# Altium schematic sheet [03] - BLE MODULE AND CONNECTIONS.SchDoc
size A; SheetNumber: 1; SheetTotal: 4
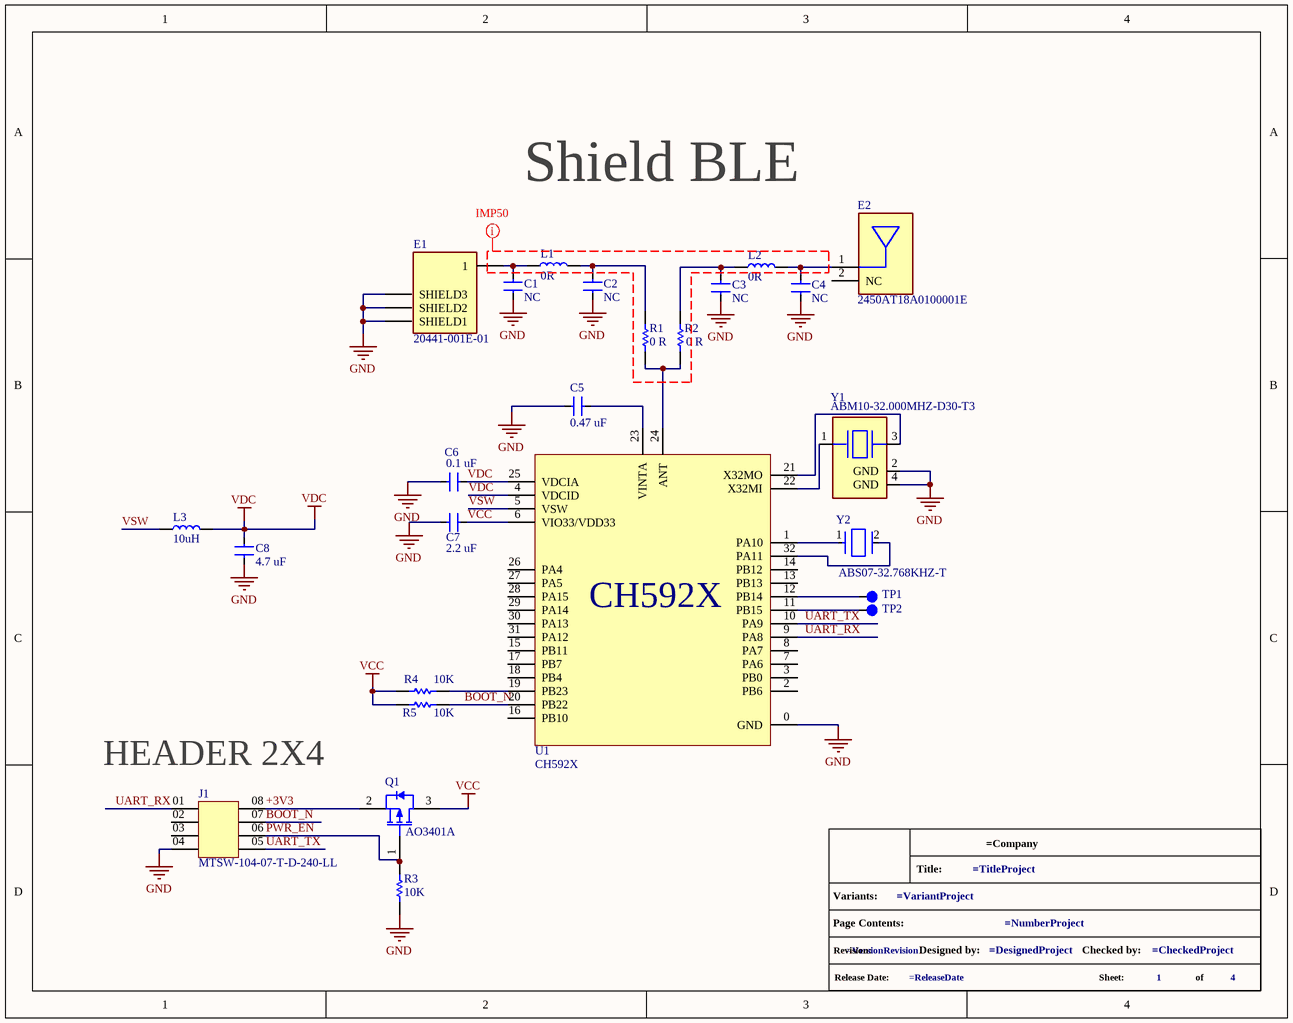
[diagram p0: [03] - BLE MODULE AND CONNECTIONS.SchDoc]

## Parts
C1  NC  [C0402]
C2  NC  [C0402]
C3  NC  [C0402]
C4  NC  [C0402]
C5  0.47 uF  [C0402]
C6  0.1 uF  [C0402]
C7  2.2 uF  [C0402]
C8  4.7 uF  [C0402]
E1  20441-001E-01  [IPEX_20441-001E-01]
E2  2450AT18A0100001E  [XCVR_2450AT18A0100001E]
GPH?  info_project  (value not drawn)  (graphical)
J1  MTSW-104-07-T-D-240-LL  [SAMTEC_MTSW-104-07-T-D-240-LL]
L1  0R  [L0402]
L2  0R  [L0402]
L3  10uH  [L0402]
Q1  AO3401A  [AO-SOT-23-3L_V]
R1  0 R  [R0402]
R2  0 R  [R0402]
R3  10K  [R0402]
R4  10K  [R0402]
R5  10K  [R0402]
TP1  TestPoint  [Test Point]  (value not drawn)  (no BOM)
TP2  TestPoint  [Test Point]  (value not drawn)  (no BOM)
U1  CH592X  [QFN40P400X400X80_HS-33N]
Y1  ABM10-32.000MHZ-D30-T3  [XTAL_ABM10-32.000MHZ-D30-T3]
Y2  ABS07-32.768KHZ-T  [FP-ABS07-MFG]

## Nets
GND: C1.1 C2.1 C3.1 C4.1 C5.1 C6.1 C7.1 C8.1 E1.G1(SHIELD1) E1.G2(SHIELD2) E1.G3(SHIELD3) J1.04 R3.1 U1.0(GND) Y1.2(GND) Y1.4(GND)
VCC: C7.2 Q1.3(DRAIN) R4.2 R5.2 U1.6(VIO33/VDD33)
VDC: C6.2 C8.2 L3.2 U1.4(VDCID) U1.25(VDCIA)
+3V3: J1.08 Q1.2(SOURCE)
BOOT_N: J1.07 R5.1 U1.20(PB22)
PWR_EN: J1.06 Q1.1(GATE) R3.2
UART_RX: J1.01 U1.9(PA8)
UART_TX: J1.05 U1.10(PA9)
VSW: L3.1 U1.5(VSW)
NetC1_2: C1.2 E1.1 L1.1
NetC2_2: C2.2 L1.2 R1.2
NetC3_2: C3.2 L2.1 R2.2
NetC4_2: C4.2 E2.1(FEED) L2.2
NetC5_2: C5.2 U1.23(VINTA)
NetR1_1: R1.1 R2.1 U1.24(ANT)
NetR4_1: R4.1 U1.19(PB23)
NetTP1_1: TP1.1 U1.12(PB14)
NetTP2_1: TP2.1 U1.11(PB15)
NetU1_1: U1.1(PA10) Y2.1
NetU1_21: U1.21(X32MO) Y1.3
NetU1_22: U1.22(X32MI) Y1.1
NetU1_32: U1.32(PA11) Y2.2

Not connected (* = marked no-connect by the designer): E2 2(NC); J1 02 03; U1 2(PB6) 3(PB0) 7(PA6) 8(PA7) 13(PB13) 14(PB12) 15(PB11) 16(PB10) 17(PB7) 18(PB4) 26(PA4) 27(PA5) 28(PA15) 29(PA14) 30(PA13) 31(PA12)

## Layout directives
net class IMP50: GND

## Notes on the sheet
- Shield BLE
- (near J1) HEADER 2X4
- (in symbol info_project) Title:; Variants:; Page Contents:; Revision:; Designed by:; Checked by:; Release Date:; Sheet:; of

## Library data of the parts
C1-C4 = MLCC_0402_NC: MLCC - NC 0402; Manufacturer Part Number 1: DNP; .Mounting: SMT; .PCBChecked: NO; .SCHChecked: NO
C5 = MLCC_0402_0.47 uF: MLCC - 0.47 uF 0402; .Mounting: SMT; .PCBChecked: NO; .SCHChecked: NO
C6 = MLCC_0402_0.1 uF: MLCC - 0.1 uF 0402; .Mounting: SMT; .PCBChecked: NO; .SCHChecked: NO
C7 = MLCC_0402_2.2 uF: MLCC - 2.2 uF 0402; .Mounting: SMT; .PCBChecked: NO; .SCHChecked: NO
C8 = MLCC_0402_4.7 uF: MLCC - 4.7 uF 0402; .Mounting: SMT; .PCBChecked: NO; .SCHChecked: NO
E1 = 20441-001E-01: CONN - U.FL RF Receptacle SMD; Manufacturer 1: I-PEX; Frequency: 9GHz; Gender: Male; Impedance: 50Ω; Number of Contacts: 1; Voltage Rating: 60V; .Mounting: SMT; .PCBChecked: NO; Supplier: DigiKey; Supplier Part Number: 5378-20441-001E-01DKR-ND; RoHS: Compliant; Category: RF / Coaxial Connectors; Stock: 35351; Pricing: 1=1,04, 10=0,882, 25=0,8268, 50=0,7872, 100=0,7495, 250=0,70256, 500=0,669, 1000=0,63705, 2500=0,59717 (USD); Contact Material: Gold, Nickel; Export Control Classification Number (ECCN) Code: EAR99; Fastening Type: Snap; Height: 1.45mm; Harmonized Tariff Schedule (HTS) Code: 8536.69.40.10; Lifecycle Status: Production; Max Operating Temperature: 90°C; Min Operating Temperature: -40°C; Number of Positions: 1; Orientation: Straight; REACH SVHC: Unaffected; ComponentLink1URL: https://datasheet.octopart.com:443/20441-001E-01-I-PEX-datasheet-180039539.pdf?src-supplier=IHS; ComponentLink1Description: https://datasheet.octopart.com:443/20441-001E-01-I-PEX-datasheet-180039539.pdf?src-supplier=IHS; .SCHChecked: NO; Manufacturer Part Number 1: 20441-001E-01
E2 = 2450AT18A0100001E: ANTENNA - 2.4GHz Chip 1206; Manufacturer 1: Johanson Technology; Bandwidth: 100MHz; Gain: 0.5dB; Impedance: 50Ω; Clock Frequency: 2.5GHz; Number of Bands: 1; Power Rating: 2W; Return Loss: 9.5dB; .Mounting: SMT; .PCBChecked: NO; Supplier: DigiKey; Supplier Part Number: 712-2450AT18A0100001EDKR-ND; RoHS: Compliant; Category: RF Antennas; Stock: 203443; Pricing: 1=0,52, 10=0,446, 25=0,4196, 100=0,384, 250=0,36244, 500=0,3472, 1000=0,3328 (USD); Country of Origin: Taiwan; Export Control Classification Number (ECCN) Code: EAR99; Height: 1.4mm; Harmonized Tariff Schedule (HTS) Code: 8529.10; Introduction Date: 2024-07-01; Lifecycle Status: Production; Max Operating Temperature: 125°C; Min Operating Temperature: -40°C; REACH SVHC: Unaffected; ComponentLink1URL: https://datasheet.octopart.com:443/2450AT18A0100001E-Johanson-datasheet-137404838.pdf?src-supplier=Upverter; ComponentLink1Description: https://datasheet.octopart.com:443/2450AT18A0100001E-Johanson-datasheet-137404838.pdf?src-supplier=Upverter; ComponentLink2URL: https://datasheet.octopart.com:443/2450AT18A0100001E-Johanson-datasheet-101575227.pdf?src-supplier=Newark; ComponentLink2Description: https://datasheet.octopart.com:443/2450AT18A0100001E-Johanson-datasheet-101575227.pdf?src-supplier=Newark; .SCHChecked: NO; Manufacturer Part Number 1: 2450AT18A0100001E
GPH? = info_project: GRAPHICAL - Info Project
J1 = MTSW-104-07-T-D-240-LL: CONN - Header 2x4 2.54mm THT; Manufacturer Lifecycle Status: PRODUCTION; Manufacturer 1: Samtec; Gender: Male; Number of Contacts: 8; .PCBChecked: NO; Supplier: DigiKey; Supplier Part Number: 612-MTSW-104-07-T-D-240-LL-ND; RoHS: Compliant; Category: Headers and Wire Housings; Pricing: 1=0,56 (USD); Contact Material: Bronze; Contact Plating: Tin; Lead Free: Lead Free; Lead Pitch: 2.54mm; Lifecycle Status: Production; Mounting Technology: Through Hole; Number of Rows: 2; Packaging: Bulk; Pitch: 2.54mm; Radiation Hardening: No; Termination: Solder; ComponentLink1URL: https://datasheet.octopart.com:443/MTSW-104-07-T-D-240-LL-Samtec-datasheet-97134619.pdf?src-supplier=Samtec; ComponentLink1Description: https://datasheet.octopart.com:443/MTSW-104-07-T-D-240-LL-Samtec-datasheet-97134619.pdf?src-supplier=Samtec; ComponentLink2URL: https://sigma.octopart.com:443/97134620/technical_drawing/Samtec-MTSW-104-07-T-D-240-LL.pdf?src-supplier=Samtec; ComponentLink2Description: https://sigma.octopart.com:443/97134620/technical_drawing/Samtec-MTSW-104-07-T-D-240-LL.pdf?src-supplier=Samtec; ComponentLink3URL: https://datasheet.octopart.com:443/MTSW-104-07-T-D-240-LL-Samtec-datasheet-118493423.pdf?src-supplier=Electro+Sonic; ComponentLink3Description: https://datasheet.octopart.com:443/MTSW-104-07-T-D-240-LL-Samtec-datasheet-118493423.pdf?src-supplier=Electro+Sonic; ComponentLink4URL: https://datasheet.octopart.com:443/MTSW-104-07-T-D-240-LL-Samtec-datasheet-86819181.pdf?src-supplier=Sager+Electronics; ComponentLink4Description: https://datasheet.octopart.com:443/MTSW-104-07-T-D-240-LL-Samtec-datasheet-86819181.pdf?src-supplier=Sager+Electronics; ComponentLink5URL: https://datasheet.octopart.com:443/MTSW-104-07-T-D-240-LL-Samtec-datasheet-166224765.pdf?src-supplier=Sager+Electronics; ComponentLink5Description: https://datasheet.octopart.com:443/MTSW-104-07-T-D-240-LL-Samtec-datasheet-166224765.pdf?src-supplier=Sager+Electronics; ComponentLink6URL: https://datasheet.octopart.com:443/MTSW-104-07-T-D-240-LL-Samtec-datasheet-158401026.pdf?src-supplier=Sager+Electronics; ComponentLink6Description: https://datasheet.octopart.com:443/MTSW-104-07-T-D-240-LL-Samtec-datasheet-158401026.pdf?src-supplier=Sager+Electronics; ComponentLink7URL: https://datasheet.octopart.com:443/MTSW-104-07-T-D-240-LL-Samtec-datasheet-151470471.pdf?src-supplier=Sager+Electronics; ComponentLink7Description: https://datasheet.octopart.com:443/MTSW-104-07-T-D-240-LL-Samtec-datasheet-151470471.pdf?src-supplier=Sager+Electronics; ComponentLink8URL: https://datasheet.octopart.com:443/MTSW-104-07-T-D-240-LL-Samtec-datasheet-180249843.pdf?src-supplier=JRH+Electronics; ComponentLink8Description: https://datasheet.octopart.com:443/MTSW-104-07-T-D-240-LL-Samtec-datasheet-180249843.pdf?src-supplier=JRH+Electronics; ComponentLink9URL: https://datasheet.octopart.com:443/MTSW-104-07-T-D-240-LL-Samtec-datasheet-104272029.pdf?src-supplier=Newark; ComponentLink9Description: https://datasheet.octopart.com:443/MTSW-104-07-T-D-240-LL-Samtec-datasheet-104272029.pdf?src-supplier=Newark; .Mounting: THT; .SCHChecked: NO; Manufacturer Part Number 1: MTSW-104-07-T-D-240-LL
L1 L2 = Inductor_0402: INDUCTOR - 0R 0402; .Mounting: SMT; .PCBChecked: NO; .SCHChecked: NO
L3 = Inductor_0402_10uH: INDUCTOR - 10uH - 0402; .Mounting: SMT; .PCBChecked: NO; .SCHChecked: NO
Q1 = AO3401A: MOSFET - P-Ch -30V SOT-23; Manufacturer 1: Alpha & Omega Semiconductor; Continuous Drain Current (ID): 4A; Drain to Source Resistance: 50mΩ; Gate to Source Voltage (Vgs): 12V; Input Capacitance: 1.2nF; Max Junction Temperature (Tj): 150°C; Max Power Dissipation: 1.4W; Min Breakdown Voltage: 30V; Number of Channels: 1; Rds On Max: 44mΩ; Threshold Voltage: -900mV; Turn-Off Delay Time: 41ns; Turn-On Delay Time: 6.5ns; .Mounting: SMT; .PCBChecked: NO; Supplier: DigiKey; Supplier Part Number: 785-1001-6-ND; RoHS: Compliant; Category: MOSFETs; Stock: 369049; Pricing: 1=0,52, 10=0,322, 50=0,2332, 100=0,2043, 500=0,15316 (USD); Case/Package: TO-236-3; Country of Origin: Mainland China; Drain to Source Breakdown Voltage: -30V; Drain to Source Voltage (Vds): -30V; Export Control Classification Number (ECCN) Code: EAR99; Height: 1.25mm; Introduction Date: 2007-04-10; Lead Free: Lead Free; Lifecycle Status: Production; Max Operating Temperature: 150°C; Min Operating Temperature: -55°C; Mounting Technology: Surface Mount; Number of Elements: 1; Pins: 3; Number of Terminals: 3; Power Dissipation: 1.4W; Radiation Hardening: No; REACH SVHC: Unaffected; Schedule B: 8541290080, 8541290080|8541290080|8541290080|8541290080|8541290080; ComponentLink1URL: https://datasheet.octopart.com:443/AO3401A-Alpha-%26-Omega-Semiconductor-datasheet-11631723.pdf?src-supplier=IHS; ComponentLink1Description: https://datasheet.octopart.com:443/AO3401A-Alpha-%26-Omega-Semiconductor-datasheet-11631723.pdf?src-supplier=IHS; ComponentLink2URL: https://sigma.octopart.com:443/138895710/technical_drawing/Alpha-%26-Omega-Semiconductor-AO3401A.pdf?src-supplier=Upverter; ComponentLink2Description: https://sigma.octopart.com:443/138895710/technical_drawing/Alpha-%26-Omega-Semiconductor-AO3401A.pdf?src-supplier=Upverter; ComponentLink3URL: https://sigma.octopart.com:443/140150677/technical_drawing/Alpha-%26-Omega-Semiconductor-AO3401A.pdf?src-supplier=Alpha+%26+Omega+Semiconductor+SCT; ComponentLink3Description: https://sigma.octopart.com:443/140150677/technical_drawing/Alpha-%26-Omega-Semiconductor-AO3401A.pdf?src-supplier=Alpha+%26+Omega+Semiconductor+SCT; ComponentLink4URL: https://datasheet.octopart.com:443/AO3401A-Alpha-%26-Omega-Semiconductor-datasheet-14060796.pdf?src-supplier=iiiC; ComponentLink4Description: https://datasheet.octopart.com:443/AO3401A-Alpha-%26-Omega-Semiconductor-datasheet-14060796.pdf?src-supplier=iiiC; .SCHChecked: NO; Manufacturer Part Number 1: AO3401A
R1 R2 = Resistor_0402_0R: RESISTOR - 0R 0402; .Mounting: SMT; .PCBChecked: NO; .SCHChecked: NO
R3-R5 = Resistor_0402_10K: RESISTOR - 10K 0402; .Mounting: SMT; .PCBChecked: NO; .SCHChecked: NO
TP1 TP2 = Test_Point: MECH - Test Points; .PCBChecked: NO; .Mounting: N/A; .SCHChecked: NO
U1 = CH592X: MODULE - CH592X BLE 5.4 SoC QFN-32; Manufacturer 1: WCH; .Mounting: SMT; .PCBChecked: NO; .SCHChecked: NO; Manufacturer Part Number 1: CH592X
Y1 = ABM10-32.000MHZ-D30-T3: Crystal 32MHz ±20ppm (Tol) ±30ppm (Stability) 10pF FUND 70Ohm 4-Pin Ultra Mini-CSMD T/R; Manufacturer: Abracon; Part Series: ABM10; ESR (Equivalent Series Resistance): 70Ω; Frequency Tolerance: 0.002%; Supplier: DigiKey; Supplier Part Number: 535-10936-6-ND; Manufacturer Part Number: ABM10-32.000MHZ-D30-T3; RoHS: Compliant; Category: Crystals; Stock: 20033; Pricing: 1=1,11, 10=0,964, 25=0,912, 50=0,8742, 100=0,838, 250=0,79248, 500=0,7597, 1000=0,72829 (USD); Case/Package: CSMD; China RoHS: Compliant; Country of Origin: Taiwan; Depth: 2mm; Frequency: 32MHz; Frequency Stability: 30ppm; Height: 700µm; Height - Seated (Max): 500µm; Introduction Date: 2015-04-21; Lead Free: Lead Free; Length: 2.5mm; Lifecycle Status: Production; Load Capacitance: 10pF; Max Operating Temperature: 85°C; Min Operating Temperature: -40°C; Mounting Technology: Surface Mount; Pins: 4; REACH SVHC: Unaffected; Schedule B: 8541600060, 8541600060|8541600060, 8541600060|8541600060|8541600060, 8541600060|8541600060|8541600060|8541600060; ESR: 70Ω; Termination: SMD/SMT; Tolerance: 0.002%; Width: 2mm; ComponentLink1URL: https://datasheet.octopart.com:443/ABM10-32.000MHZ-D30-T3-Abracon-datasheet-182204619.pdf?src-supplier=IHS; ComponentLink1Description: https://datasheet.octopart.com:443/ABM10-32.000MHZ-D30-T3-Abracon-datasheet-182204619.pdf?src-supplier=IHS; ComponentLink2URL: https://datasheet.octopart.com:443/ABM10-32.000MHZ-D30-T3-Abracon-datasheet-41232962.pdf?src-supplier=JRH+Electronics; ComponentLink2Description: https://datasheet.octopart.com:443/ABM10-32.000MHZ-D30-T3-Abracon-datasheet-41232962.pdf?src-supplier=JRH+Electronics; ComponentLink3URL: https://datasheet.octopart.com:443/ABM10-32.000MHZ-D30-T3-Abracon-datasheet-37124829.pdf?src-supplier=Newark; ComponentLink3Description: https://datasheet.octopart.com:443/ABM10-32.000MHZ-D30-T3-Abracon-datasheet-37124829.pdf?src-supplier=Newark; ComponentLink4URL: https://datasheet.octopart.com:443/ABM10-32.000MHZ-D30-T3-Abracon-datasheet-13380592.pdf?src-supplier=Sager+Electronics; ComponentLink4Description: https://datasheet.octopart.com:443/ABM10-32.000MHZ-D30-T3-Abracon-datasheet-13380592.pdf?src-supplier=Sager+Electronics; ComponentLink5URL: https://datasheet.octopart.com:443/ABM10-32.000MHZ-D30-T3-Abracon-datasheet-11045593.pdf?src-supplier=Sager+Electronics; ComponentLink5Description: https://datasheet.octopart.com:443/ABM10-32.000MHZ-D30-T3-Abracon-datasheet-11045593.pdf?src-supplier=Sager+Electronics; ComponentLink6URL: https://datasheet.octopart.com:443/ABM10-32.000MHZ-D30-T3-Abracon-datasheet-8882520.pdf?src-supplier=Sager+Electronics; ComponentLink6Description: https://datasheet.octopart.com:443/ABM10-32.000MHZ-D30-T3-Abracon-datasheet-8882520.pdf?src-supplier=Sager+Electronics; ComponentLink7URL: https://datasheet.octopart.com:443/ABM10-32.000MHZ-D30-T3-Abracon-datasheet-8456701.pdf?src-supplier=Sager+Electronics; ComponentLink7Description: https://datasheet.octopart.com:443/ABM10-32.000MHZ-D30-T3-Abracon-datasheet-8456701.pdf?src-supplier=Sager+Electronics; ComponentLink8URL: https://datasheet.octopart.com:443/ABM10-32.000MHZ-D30-T3-Abracon-datasheet-8326102.pdf?src-supplier=Sager+Electronics; ComponentLink8Description: https://datasheet.octopart.com:443/ABM10-32.000MHZ-D30-T3-Abracon-datasheet-8326102.pdf?src-supplier=Sager+Electronics; ComponentLink9URL: https://datasheet.octopart.com:443/ABM10-32.000MHZ-D30-T3-Abracon-datasheet-5401317.pdf?src-supplier=Sager+Electronics; ComponentLink9Description: https://datasheet.octopart.com:443/ABM10-32.000MHZ-D30-T3-Abracon-datasheet-5401317.pdf?src-supplier=Sager+Electronics; ComponentLink10URL: https://datasheet.octopart.com:443/ABM10-32.000MHZ-D30-T3-Abracon-datasheet-128558403.pdf?src-supplier=X-ON; ComponentLink10Description: https://datasheet.octopart.com:443/ABM10-32.000MHZ-D30-T3-Abracon-datasheet-128558403.pdf?src-supplier=X-ON; ComponentLink11URL: https://sigma.octopart.com:443/141159849/technical_drawing/Abracon-ABM10-32.000MHZ-D30-T3.pdf?src-supplier=Abracon+SCT; ComponentLink11Description: https://sigma.octopart.com:443/141159849/technical_drawing/Abracon-ABM10-32.000MHZ-D30-T3.pdf?src-supplier=Abracon+SCT; ComponentLink12URL: http://sigma.octopart.com:80/conflict_mineral_statement/Abracon-company-27.pdf?src-supplier=Compliance+Statements; ComponentLink12Description: http://sigma.octopart.com:80/conflict_mineral_statement/Abracon-company-27.pdf?src-supplier=Compliance+Statements
Y2 = CMP-0447-00001-4: XTAL - 32.768 kHz 12.5pF SMD; Manufacturer 1: Abracon; ESR (Equivalent Series Resistance): 70kR; Frequency Tolerance: 20ppm; .Mounting: SMT; .PCBChecked: NO; Radiation Hardening: No; Frequency: 32.768kHz; Length: 3.2mm; Max Operating Temperature: 85°C; Number of Pins: 2; Series: ABS07; Min Operating Temperature: -40°C; Packaging: Tape and Reel; Height: 0.9mm; Width: 1.5mm; Depth: 1.5mm; Load Capacitance: 12.5pF; RoHS Compliant: Yes; Tolerance: 20ppm; Termination: SMD/SMT; Lead Free: Lead Free; Series Resistance: 70kR; REACH SVHC: No SVHC; Case/Package: CSMD; Operating Frequency: 32.768 kHz; Package Quantity: 3000; .SCHChecked: NO; Manufacturer Part Number 1: ABS07-32.768KHZ-T